# Altium schematic sheet EXTI_RGB_LED.SchDoc
size A4; SheetNumber: 3; SheetTotal: 4
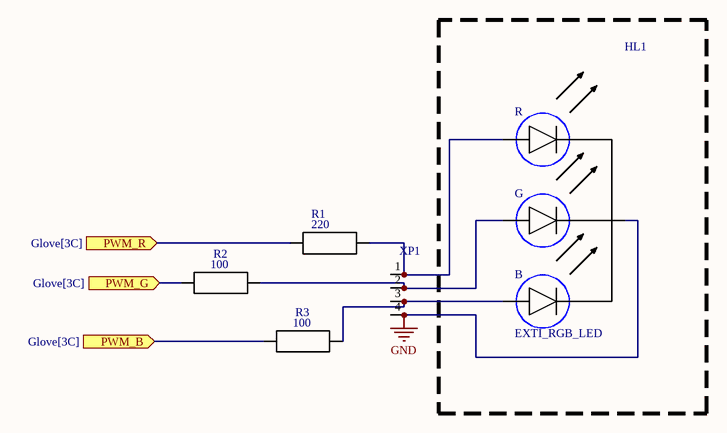
[diagram p0: EXTI_RGB_LED.SchDoc]

## Parts
HL1  EXTI_RGB_LED
R1  220  [CAPC2012X145N]
R2  100  [CAPC2012X145N]
R3  100  [CAPC2012X145N]
XP1  (no value)  [EXT_SENSOR_4pin]

## Ports
PWM_B (in, see Glove[3C]), PWM_G (in, see Glove[3C]), PWM_R (in, see Glove[3C])

## Nets
GND: HL1.4 XP1.4(IN)
PWM_B: R3.2 ; port PWM_B
PWM_G: R2.2 ; port PWM_G
PWM_R: R1.2 ; port PWM_R
NetHL1_0: HL1.0 R1.1 XP1.1(VCC)
NetHL1_1: HL1.1 R2.1 XP1.2(IN)
NetHL1_2: HL1.2 R3.1 XP1.3(IN)

## Notes on the sheet
- (in symbol EXTI_RGB_LED) R; G; B

## Library data of the parts
R1-R3 = 0805R: Resistor; Manufacturer_Name: SAMSUNG; Manufacturer_Part_Number: CL21A106KAYNNNE; Datasheet Link: https://datasheet.datasheetarchive.com/originals/distributors/Datasheets_SAMA/6a45835c9b7400e9b49c55c38a8ff4a2.pdf; Height: 1.45mm; Mouser Part Number: 187-CL21A106KAYNNNE; Mouser Price/Stock: https://www.mouser.co.uk/ProductDetail/Samsung-Electro-Mechanics/CL21A106KAYNNNE?qs=yOVawPpwOwmTXAd4dJtNjA%3D%3D; Arrow Part Number: CL21A106KAYNNNE; Arrow Price/Stock: https://www.arrow.com/en/products/cl21a106kaynnne/samsung-electro-mechanics?utm_currency=USD&region=nac
XP1 = EXT_SENSOR_4pin